# Altium project Dimmer-Board-v1.0.PrjPcb
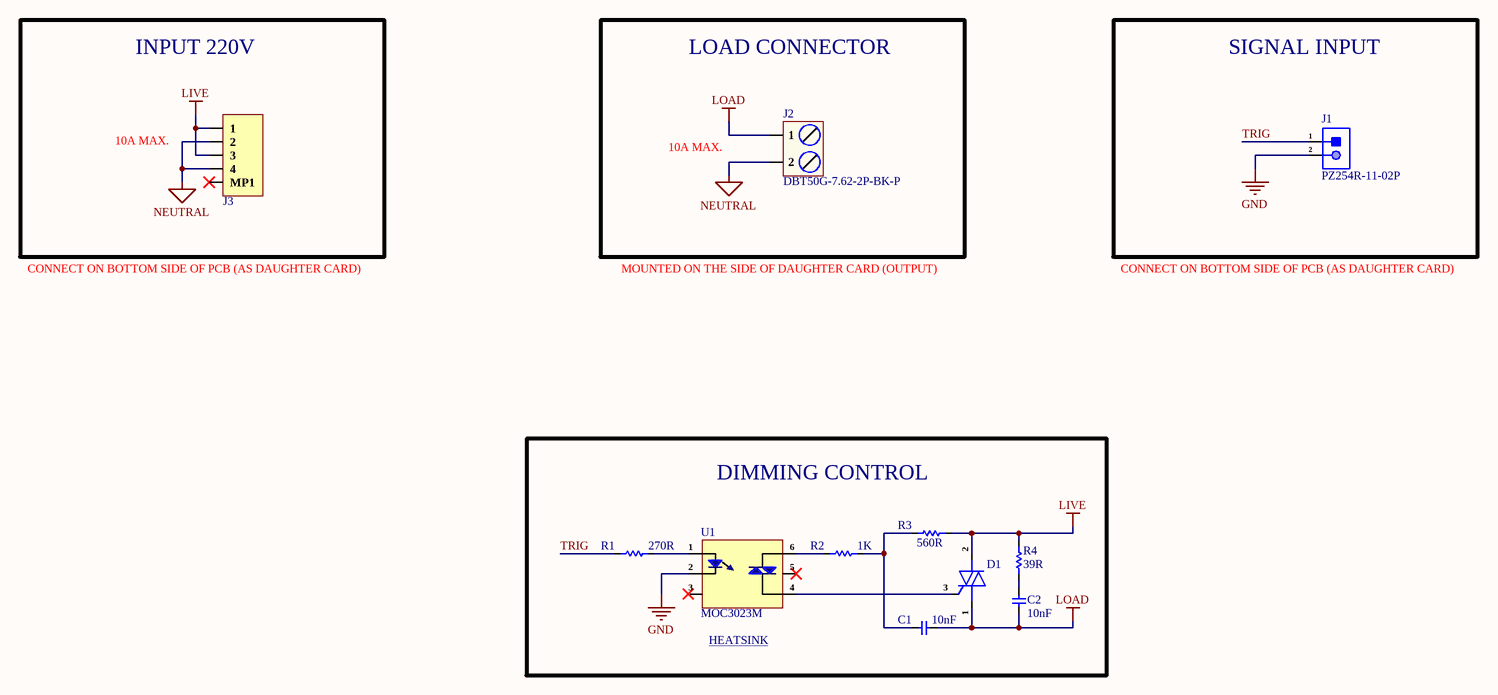
[diagram p0: Dimmer-Sheet.SchDoc]
1 sheet, 11 parts. Net scope: global (net labels, ports and power ports of the same name join across sheets).
Board file: Dimmer_Board.PcbDoc

## Sheet Dimmer-Sheet.SchDoc
size 420 x 297 mm; SheetNumber: 1; SheetTotal: 1

### Parts
C1  10nF  [KP103J2G0501]
C2  10nF  [KP103J2G0501]
D1  BTA41-600BRG  [TOP3]  (value not drawn)
J1  PZ254R-11-02P  [HDR1X2 (R/A Male)]
J2  DBT50G-7.62-2P-BK-P  [DBT50G-7.62-2P-BK-P]
J3  0444280401  [0444280401-]  (value not drawn)
R1  270R  [Res-0603]
R2  1K  [MFR3WSJT-73-1K]
R3  560R  [EWWR0006J500RT9]
R4  39R  [MFR2WSJT-73-39R]
U1  MOC3023M  [6 Pin Dip]

### Blocks framed on the sheet
INPUT 220V: J3
LOAD CONNECTOR: J2
SIGNAL INPUT: J1
DIMMING CONTROL: C1 C2 D1 R1-R4 U1

### Nets
GND: J1.2 U1.2(Ca)
LIVE: D1.2(M2) J3.1 J3.3 R3.2 R4.2
LOAD: C1.2 C2.1 D1.1(M1) J2.1
NEUTRAL: J2.2 J3.2 J3.4
TRIG: J1.1 R1.1
NetC1_1: C1.1 R2.2 R3.1
NetC2_2: C2.2 R4.1
NetD1_3: D1.3(G) U1.4(Terminal)
NetR1_2: R1.2 U1.1(An)
NetR2_1: R2.1 U1.6(Terminal)

Not connected (* = marked no-connect by the designer): J3 MP1*; U1 3(NC)* 5(Substrate)*

### Notes on the sheet
- 10A MAX.
- CONNECT ON BOTTOM SIDE OF PCB (AS DAUGHTER CARD)
- MOUNTED ON THE SIDE OF DAUGHTER CARD (OUTPUT)
- (near U1) HEATSINK <https://www.lcsc.com/product-detail/Heat-sink-heatsink_XSD-35-12-25_C4663.html>
- File:
- Title:
- Date:
- Page
- Num:
- Total:
- Drawn By: Huzaifa Ali

### Library data of the parts
C1 C2 = KP103J2G0501: 10nF -40℃~+100℃ ±5% 400V Plugin,P=5mm Polypropylene Film Capacitors (CBB) ROHS; Manufacturer: KYET; Manufacturer Part Number: KP103J2G0501; Package: Plugin,P=5mm; LCSC Part Number: C3019055; Item Type: Capacitor; ComponentLink1Description: LCSC; ComponentLink1URL: https://www.lcsc.com/product-detail/Polypropylene-Film-Capacitors-CBB_KYET-KP103J2G0501_C3019055.html
D1 = BTA41-600BRG: 80mA 50mA 600V TOP-3 Thyristors (SCR)/Modules ROHS; Manufacturer: STMicroelectronics; ComponentLink1Description: LCSC Link; ComponentLink1URL: https://www.lcsc.com/product-detail/Thyristors-SCR-Modules_STMicroelectronics-BTA41-600BRG_C9103.html; Manufacturer Part Number: BTA41-600BRG; LCSC Part Number: C9103; Item Type: Thyristors; Package: TOP-3
J1 = PZ254R-11-02P: Right-Angle Square Pins 2.5mm 2P 6mm -40℃~+105℃ 2.54mm Plugin Black Brass 1x2P Push-Pull,P=2.54mm Pin Headers ROHS; Manufacturer: XFCN; Item Type: R/A Male Header; Manufacturer Part Number: PZ254R-11-02P; Package: Push-Pull,P=2.54mm; LCSC Part Number: C492410; ComponentLink1Description: LCSC; ComponentLink1URL: https://www.lcsc.com/product-detail/Pin-Headers_XFCN-PZ254R-11-02P_C492410.html
J2 = DBT50G-7.62-2P-BK-P: 1x2P Corner With Cover Plate 2 1 7.62mm -40℃~+105℃ 20A 300V Black 12~22 Straight Needle Plugin,P=7.62mm Barrier Terminal Blocks ROHS; Manufacturer: DORABO; Manufacturer Part Number: DBT50G-7.62-2P-BK-P; Package: Plugin,P=7.62mm; LCSC Part Number: C496127; Item Type: Terminal Block; ComponentLink1Description: LCSC; ComponentLink1URL: https://www.lcsc.com/product-detail/Barrier-Terminal-Blocks_DORABO-DBT50G-7-62-2P-BK-P_C496127.html
J3 = 0444280401: CONN HEADER R/A 4POS 3MM; Manufacturer: Molex; Item Type: Connector; Supplier: Digikey; Supplier Part Number: 23-0444280401-ND; Manufacturer Part Number: 0444280401; RoHS: Yes; Stock: 7960; Pricing: 1=1.73, 10=1.47, 80=1.21413, 945=1.12499 (USD); ComponentLink1URL: https://datasheet.ciiva.com/3119/0444280401-pcb-headers-3119509.pdf?src-supplier=Avnet; ComponentLink1Description: https://datasheet.ciiva.com/3119/0444280401-pcb-headers-3119509.pdf?src-supplier=Avnet; LCSC Part Number: C17645517; ComponentLink2Description: LCSC; ComponentLink2URL: https://www.lcsc.com/product-detail/Wire-To-Board-Connector_MOLEX-0444280401_C17645517.html
R1 = RT0603BRE07270RL: RES SMD 270 OHM 0.1% 1/10W 0603; Manufacturer: Yageo; Max Power Dissipation: 100mW; Temperature Coefficient: 50ppm/°C; Voltage Rating (DC): 50V; Item Type: Resistor; Supplier 1: Digi-Key; Manufacturer Part Number: RT0603BRE07270RL; RoHS: Yes; Category: Chip SMD Resistors; Pricing 1: 5000=0.04770 (USD); Case/Package: 0603; Min Operating Temperature: -55°C; Max Operating Temperature: 125°C; Resistance: 270R; Tolerance: 0.1%; Packaging: Tape and Reel; Package Quantity: 5000; Resistor Type: Thin Film; Number of Terminations: 2; Series: RT; Construction: Rectangular; Length: 0.063inch; Width: 0.031inch; Height: 0.022inch; Depth: 0.8mm; Military Standard: Not; Lead Free: Lead Free; RoHS Compliant: Yes; ComponentLink1URL: https://datasheet.ciiva.com/2584/pyu-rt-1-to-0-05-rohs-l-5-2584379.pdf?src-supplier=Digi-Key; ComponentLink1Description: https://datasheet.ciiva.com/2584/pyu-rt-1-to-0-05-rohs-l-5-2584379.pdf?src-supplier=Digi-Key; Supplier Part Number 1: RT0603BRE07270RL-ND; LCSC Part Number: C705836
R2 = MFR3WSJT-73-1K: RES 1K OHM 5% 3W AXIAL; Manufacturer: Yageo; Item Type: Resistor; Value: 1kR; Supplier: Digikey; LCSC Part Number: C176599; Manufacturer Part Number: MFR3WSJT-73-1K; RoHS: Yes; Pricing: 5000=0.04394 (USD); Case/Package: Axial; Min Operating Temperature: -55°C; Max Operating Temperature: 155°C; Series: MFR; Packaging: Tape and Reel; Tolerance: 5%; Max Power Dissipation: 3W; Number of Terminations: 2; RoHS Compliant: Yes; ComponentLink1URL: http://www.yageo.com/NewPortal/yageodocoutput?fileName=/pdf/throughhole/Yageo_LR_MFR_2013.pdf&src-supplier=Digikey; ComponentLink1Description: http://www.yageo.com/NewPortal/yageodocoutput?fileName=/pdf/throughhole/Yageo_LR_MFR_2013.pdf&src-supplier=Digikey
R3 = EWWR0006J560RT9: Wirewound Resistors 560Ω 6W ±250ppm/℃ ±5% Plugin,D8xL23.5mm Through Hole Resistors ROHS; Manufacturer: RESI; Manufacturer Part Number: EWWR0006J560RT9; Package: Plugin,D8xL23.5mm; LCSC Part Number: C348992; Item Type: Resistor; ComponentLink1Description: LCSC; ComponentLink1URL: https://www.lcsc.com/product-detail/Through-Hole-Resistors_RESI-EWWR0006J560RT9_C348992.html
R4 = MFR2WSJT-73-39R: Metal Film Resistors 39Ω 2W ±5% Plugin,D4.5xL11.5mm Through Hole Resistors ROHS; Manufacturer: YAGEO; Manufacturer Part Number: MFR2WSJT-73-39R; Package: Plugin,D4.5xL11.5mm; LCSC Part Number: C176578; Item Type: Resistor; ComponentLink1Description: LCSC; ComponentLink1URL: https://www.lcsc.com/product-detail/Through-Hole-Resistors_YAGEO-MFR2WSJT-73-39R_C176578.html
U1 = MOC3023M: OPTOISOLATOR 4.17KV TRIAC 6DIP; Manufacturer: ON Semiconductor / Fairchild; Item Type: IC; Supplier: Future Electronics; LCSC Part Number: C5240; Manufacturer Part Number: MOC3023M; RoHS: Yes; Stock: 46500; Pricing: 1=0.215, 200=0.205, 750=0.196, 2500=0.19, 10000=0.176 (USD); ComponentLink1URL: https://datasheet.ciiva.com/15118/getdatasheetpartid-110426-15118245.pdf?src-supplier=Verical; ComponentLink1Description: https://datasheet.ciiva.com/15118/getdatasheetpartid-110426-15118245.pdf?src-supplier=Verical; ComponentLink2URL: https://datasheet.ciiva.com/8074/1806097-8074079.pdf?src-supplier=Element14; ComponentLink2Description: https://datasheet.ciiva.com/8074/1806097-8074079.pdf?src-supplier=Element14; ComponentLink3URL: https://datasheet.ciiva.com/8084/moc3023m-8084955.pdf?src-supplier=Avnet; ComponentLink3Description: https://datasheet.ciiva.com/8084/moc3023m-8084955.pdf?src-supplier=Avnet; ComponentLink4URL: https://datasheet.ciiva.com/2092/moc3010m-2092979.pdf?src-supplier=Digikey; ComponentLink4Description: https://datasheet.ciiva.com/2092/moc3010m-2092979.pdf?src-supplier=Digikey